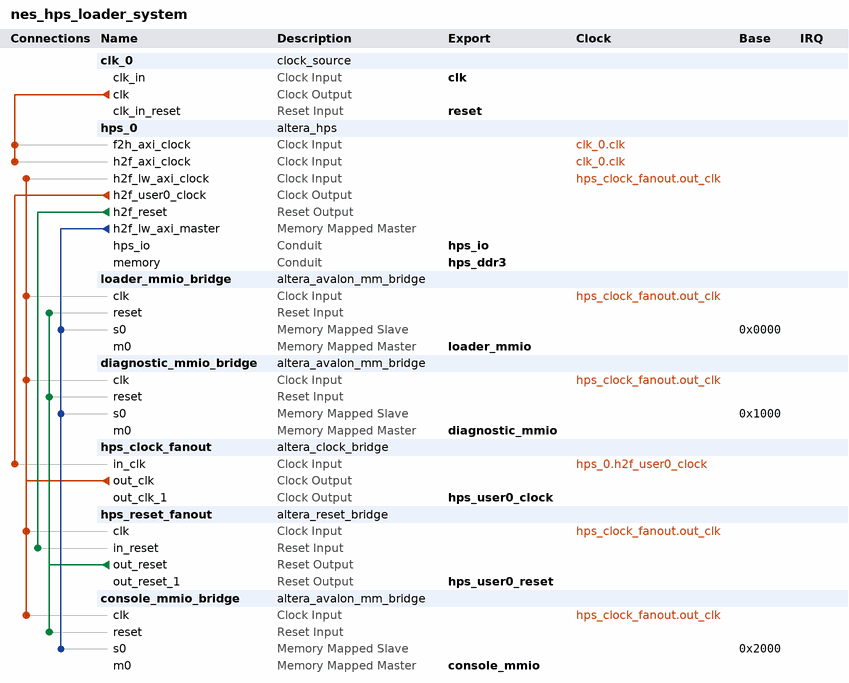
[diagram p0: system contents]
# Platform Designer (Qsys) system nes_hps_loader_system, Cyclone V 5CSEMA5F31C6
# Parameters at their usual value, and those the tool derives, are not listed.
package require -exact qsys 23.1
create_system nes_hps_loader_system
set_project_property DEVICE_FAMILY {Cyclone V}
set_project_property DEVICE 5CSEMA5F31C6

add_instance clk_0 clock_source 23.1
set_instance_parameter_value clk_0 clockFrequency 50000000

add_instance hps_0 altera_hps 23.1
set_instance_parameter_value hps_0 EMAC1_Mode RGMII
set_instance_parameter_value hps_0 EMAC1_PinMuxing {HPS I/O Set 0}
set_instance_parameter_value hps_0 F2SCLK_COLDRST_Enable false
set_instance_parameter_value hps_0 F2SCLK_DBGRST_Enable false
set_instance_parameter_value hps_0 F2SCLK_WARMRST_Enable false
set_instance_parameter_value hps_0 F2SINTERRUPT_Enable true
set_instance_parameter_value hps_0 F2S_Width 3
set_instance_parameter_value hps_0 FPGA_PERIPHERAL_OUTPUT_CLOCK_FREQ_EMAC0_GTX_CLK 100
set_instance_parameter_value hps_0 FPGA_PERIPHERAL_OUTPUT_CLOCK_FREQ_EMAC0_MD_CLK 100.0
set_instance_parameter_value hps_0 FPGA_PERIPHERAL_OUTPUT_CLOCK_FREQ_EMAC1_GTX_CLK 100
set_instance_parameter_value hps_0 FPGA_PERIPHERAL_OUTPUT_CLOCK_FREQ_EMAC1_MD_CLK 100.0
set_instance_parameter_value hps_0 HPS_PROTOCOL DDR3
set_instance_parameter_value hps_0 I2C0_Mode I2C
set_instance_parameter_value hps_0 I2C0_PinMuxing {HPS I/O Set 0}
set_instance_parameter_value hps_0 I2C1_Mode I2C
set_instance_parameter_value hps_0 I2C1_PinMuxing {HPS I/O Set 0}
set_instance_parameter_value hps_0 LWH2F_Enable true
set_instance_parameter_value hps_0 MEM_BANKADDR_WIDTH 3
set_instance_parameter_value hps_0 MEM_CLK_FREQ 400.0
set_instance_parameter_value hps_0 MEM_COL_ADDR_WIDTH 10
set_instance_parameter_value hps_0 MEM_DQ_WIDTH 32
set_instance_parameter_value hps_0 MEM_DRV_STR RZQ/7
set_instance_parameter_value hps_0 MEM_ROW_ADDR_WIDTH 15
set_instance_parameter_value hps_0 MEM_RTT_NOM RZQ/4
set_instance_parameter_value hps_0 MEM_RTT_WR RZQ/4
set_instance_parameter_value hps_0 MEM_TCL 11
set_instance_parameter_value hps_0 MEM_TFAW_NS 30.0
set_instance_parameter_value hps_0 MEM_TRAS_NS 35.0
set_instance_parameter_value hps_0 MEM_TRCD_NS 13.75
set_instance_parameter_value hps_0 MEM_TRFC_NS 260.0
set_instance_parameter_value hps_0 MEM_TRP_NS 13.75
set_instance_parameter_value hps_0 MEM_VENDOR JEDEC
set_instance_parameter_value hps_0 MEM_WTCL 8
set_instance_parameter_value hps_0 QSPI_Mode {1 SS}
set_instance_parameter_value hps_0 QSPI_PinMuxing {HPS I/O Set 0}
set_instance_parameter_value hps_0 REF_CLK_FREQ 25.0
set_instance_parameter_value hps_0 S2FCLK_USER0CLK_Enable true
set_instance_parameter_value hps_0 S2FCLK_USER2CLK 5
set_instance_parameter_value hps_0 S2F_Width 2
set_instance_parameter_value hps_0 SDIO_Mode {4-bit Data}
set_instance_parameter_value hps_0 SDIO_PinMuxing {HPS I/O Set 0}
set_instance_parameter_value hps_0 SPIM1_Mode {Single Slave Select}
set_instance_parameter_value hps_0 SPIM1_PinMuxing {HPS I/O Set 0}
set_instance_parameter_value hps_0 STM_Enable false
set_instance_parameter_value hps_0 TIMING_BOARD_AC_SKEW 0.03
set_instance_parameter_value hps_0 TIMING_BOARD_AC_TO_CK_SKEW 0.0
set_instance_parameter_value hps_0 TIMING_BOARD_DQ_TO_DQS_SKEW 0.0
set_instance_parameter_value hps_0 TIMING_BOARD_MAX_CK_DELAY 0.03
set_instance_parameter_value hps_0 TIMING_BOARD_MAX_DQS_DELAY 0.02
set_instance_parameter_value hps_0 TIMING_BOARD_SKEW_BETWEEN_DQS 0.08
set_instance_parameter_value hps_0 TIMING_BOARD_SKEW_CKDQS_DIMM_MAX 0.16
set_instance_parameter_value hps_0 TIMING_BOARD_SKEW_CKDQS_DIMM_MIN 0.09
set_instance_parameter_value hps_0 TIMING_BOARD_SKEW_WITHIN_DQS 0.01
set_instance_parameter_value hps_0 TIMING_TDH 65
set_instance_parameter_value hps_0 TIMING_TDQSCK 255
set_instance_parameter_value hps_0 TIMING_TDQSQ 125
set_instance_parameter_value hps_0 TIMING_TDS 30
set_instance_parameter_value hps_0 TIMING_TIH 140
set_instance_parameter_value hps_0 TIMING_TIS 180
set_instance_parameter_value hps_0 TIMING_TQSH 0.4
set_instance_parameter_value hps_0 UART0_Mode {No Flow Control}
set_instance_parameter_value hps_0 UART0_PinMuxing {HPS I/O Set 0}
set_instance_parameter_value hps_0 USB1_Mode SDR
set_instance_parameter_value hps_0 USB1_PinMuxing {HPS I/O Set 0}
set_instance_parameter_value hps_0 desired_cfg_clk_mhz 100.0
set_instance_parameter_value hps_0 desired_qspi_clk_mhz 400.0

add_instance loader_mmio_bridge altera_avalon_mm_bridge 23.1
set_instance_parameter_value loader_mmio_bridge ADDRESS_UNITS SYMBOLS
set_instance_parameter_value loader_mmio_bridge ADDRESS_WIDTH 6
set_instance_parameter_value loader_mmio_bridge DATA_WIDTH 32
set_instance_parameter_value loader_mmio_bridge MAX_PENDING_RESPONSES 1
set_instance_parameter_value loader_mmio_bridge PIPELINE_COMMAND 0
set_instance_parameter_value loader_mmio_bridge PIPELINE_RESPONSE 0
set_instance_parameter_value loader_mmio_bridge USE_AUTO_ADDRESS_WIDTH 0

add_instance diagnostic_mmio_bridge altera_avalon_mm_bridge 23.1
set_instance_parameter_value diagnostic_mmio_bridge ADDRESS_UNITS SYMBOLS
set_instance_parameter_value diagnostic_mmio_bridge ADDRESS_WIDTH 9
set_instance_parameter_value diagnostic_mmio_bridge DATA_WIDTH 32
set_instance_parameter_value diagnostic_mmio_bridge MAX_PENDING_RESPONSES 1
set_instance_parameter_value diagnostic_mmio_bridge PIPELINE_COMMAND 0
set_instance_parameter_value diagnostic_mmio_bridge PIPELINE_RESPONSE 0
set_instance_parameter_value diagnostic_mmio_bridge USE_AUTO_ADDRESS_WIDTH 0

add_instance hps_clock_fanout altera_clock_bridge 23.1
set_instance_parameter_value hps_clock_fanout DERIVED_CLOCK_RATE 100000000
set_instance_parameter_value hps_clock_fanout EXPLICIT_CLOCK_RATE 0
set_instance_parameter_value hps_clock_fanout NUM_CLOCK_OUTPUTS 2

add_instance hps_reset_fanout altera_reset_bridge 23.1
set_instance_parameter_value hps_reset_fanout ACTIVE_LOW_RESET 0
set_instance_parameter_value hps_reset_fanout NUM_RESET_OUTPUTS 2
set_instance_parameter_value hps_reset_fanout SYNCHRONOUS_EDGES deassert

add_instance console_mmio_bridge altera_avalon_mm_bridge 23.1
set_instance_parameter_value console_mmio_bridge ADDRESS_UNITS SYMBOLS
set_instance_parameter_value console_mmio_bridge ADDRESS_WIDTH 5
set_instance_parameter_value console_mmio_bridge DATA_WIDTH 32
set_instance_parameter_value console_mmio_bridge MAX_PENDING_RESPONSES 1
set_instance_parameter_value console_mmio_bridge PIPELINE_COMMAND 0
set_instance_parameter_value console_mmio_bridge PIPELINE_RESPONSE 0
set_instance_parameter_value console_mmio_bridge USE_AUTO_ADDRESS_WIDTH 0

# connections
add_connection clk_0.clk hps_0.f2h_axi_clock clock
add_connection clk_0.clk hps_0.h2f_axi_clock clock
add_connection hps_0.h2f_user0_clock hps_clock_fanout.in_clk clock
add_connection hps_clock_fanout.out_clk console_mmio_bridge.clk clock
add_connection hps_clock_fanout.out_clk diagnostic_mmio_bridge.clk clock
add_connection hps_clock_fanout.out_clk hps_0.h2f_lw_axi_clock clock
add_connection hps_clock_fanout.out_clk hps_reset_fanout.clk clock
add_connection hps_clock_fanout.out_clk loader_mmio_bridge.clk clock
add_connection hps_0.h2f_reset hps_reset_fanout.in_reset reset
add_connection hps_reset_fanout.out_reset console_mmio_bridge.reset reset
add_connection hps_reset_fanout.out_reset diagnostic_mmio_bridge.reset reset
add_connection hps_reset_fanout.out_reset loader_mmio_bridge.reset reset
add_connection hps_0.h2f_lw_axi_master console_mmio_bridge.s0 avalon
set_connection_parameter_value hps_0.h2f_lw_axi_master/console_mmio_bridge.s0 baseAddress 0x2000
add_connection hps_0.h2f_lw_axi_master diagnostic_mmio_bridge.s0 avalon
set_connection_parameter_value hps_0.h2f_lw_axi_master/diagnostic_mmio_bridge.s0 baseAddress 0x1000
add_connection hps_0.h2f_lw_axi_master loader_mmio_bridge.s0 avalon
set_connection_parameter_value hps_0.h2f_lw_axi_master/loader_mmio_bridge.s0 baseAddress 0x0000

# exported interfaces
add_interface clk clock sink
set_interface_property clk EXPORT_OF clk_0.clk_in
add_interface hps_ddr3 conduit end
set_interface_property hps_ddr3 EXPORT_OF hps_0.memory
add_interface hps_io conduit end
set_interface_property hps_io EXPORT_OF hps_0.hps_io
add_interface hps_user0_clock clock source
set_interface_property hps_user0_clock EXPORT_OF hps_clock_fanout.out_clk_1
add_interface hps_user0_reset reset source
set_interface_property hps_user0_reset EXPORT_OF hps_reset_fanout.out_reset_1
add_interface loader_mmio avalon master
set_interface_property loader_mmio EXPORT_OF loader_mmio_bridge.m0
add_interface diagnostic_mmio avalon master
set_interface_property diagnostic_mmio EXPORT_OF diagnostic_mmio_bridge.m0
add_interface console_mmio avalon master
set_interface_property console_mmio EXPORT_OF console_mmio_bridge.m0
add_interface reset reset sink
set_interface_property reset EXPORT_OF clk_0.clk_in_reset

set_interconnect_requirement {$system} qsys_mm.clockCrossingAdapter HANDSHAKE
set_interconnect_requirement {$system} qsys_mm.enableEccProtection FALSE
set_interconnect_requirement {$system} qsys_mm.insertDefaultSlave FALSE
set_interconnect_requirement {$system} qsys_mm.maxAdditionalLatency 3

save_system nes_hps_loader_system.qsys
